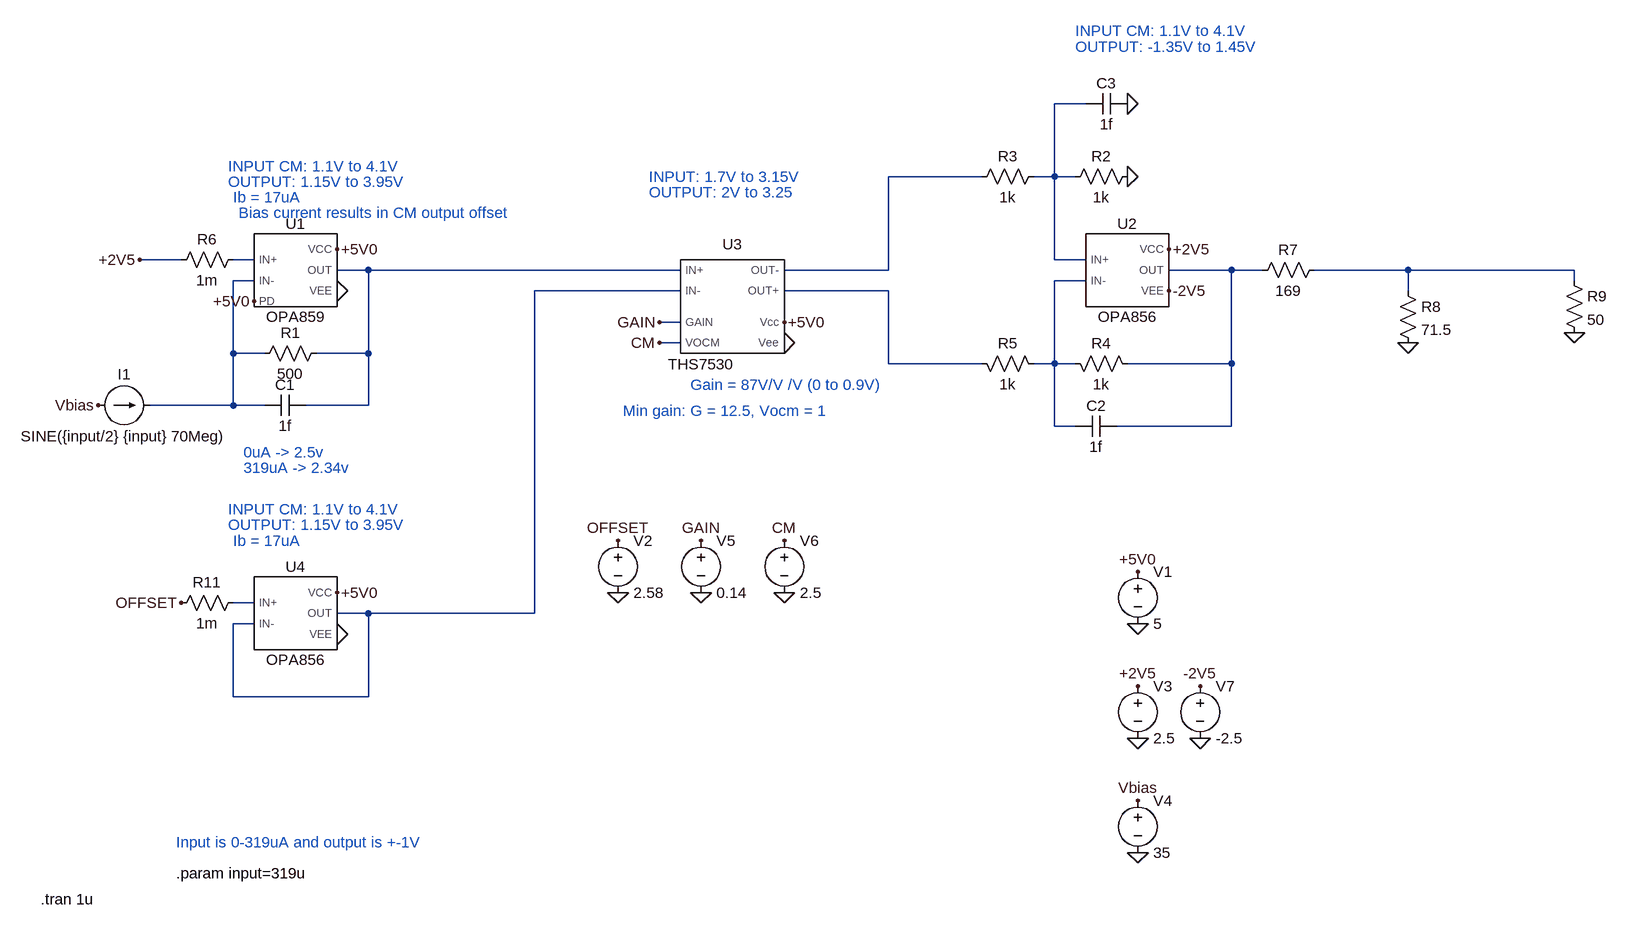
[diagram p0: schematic Ball_DC.asc]
Ball_DC.asc, the LTspice schematic file:
Version 4
SHEET 1 2072 1204
WIRE 1264 -96 1216 -96
WIRE 1104 16 960 16
WIRE 1216 16 1216 -96
WIRE 1216 16 1184 16
WIRE 1248 16 1216 16
WIRE -128 144 -192 144
WIRE -16 144 -48 144
WIRE 1216 144 1216 16
WIRE 1264 144 1216 144
WIRE 160 160 112 160
WIRE 640 160 160 160
WIRE 960 160 960 16
WIRE 960 160 800 160
WIRE 1488 160 1392 160
WIRE 1536 160 1488 160
WIRE 1760 160 1616 160
WIRE 2016 160 1760 160
WIRE -16 176 -48 176
WIRE 1264 176 1216 176
WIRE 2016 176 2016 160
WIRE 640 192 416 192
WIRE 960 192 800 192
WIRE 1760 192 1760 160
WIRE 640 240 608 240
WIRE 640 272 608 272
WIRE -48 288 -48 176
WIRE 0 288 -48 288
WIRE 160 288 160 160
WIRE 160 288 80 288
WIRE 960 304 960 192
WIRE 1104 304 960 304
WIRE 1216 304 1216 176
WIRE 1216 304 1184 304
WIRE 1248 304 1216 304
WIRE 1488 304 1488 160
WIRE 1488 304 1328 304
WIRE -48 368 -48 288
WIRE -48 368 -176 368
WIRE 0 368 -48 368
WIRE 160 368 160 288
WIRE 160 368 64 368
WIRE 1216 400 1216 304
WIRE 1248 400 1216 400
WIRE 1488 400 1488 304
WIRE 1488 400 1312 400
WIRE -16 672 -48 672
WIRE 160 688 112 688
WIRE 416 688 416 192
WIRE 416 688 160 688
WIRE -16 704 -48 704
WIRE -48 816 -48 704
WIRE 160 816 160 688
WIRE 160 816 -48 816
FLAG 1344 704 0
FLAG 1344 624 +5V0
FLAG 1344 880 0
FLAG 1344 800 +2V5
FLAG 1344 1056 0
FLAG 1344 976 Vbias
FLAG -192 144 +2V5
FLAG 112 128 +5V0
FLAG 112 192 0
FLAG -256 368 Vbias
FLAG 672 656 0
FLAG 672 576 GAIN
FLAG 800 656 0
FLAG 800 576 CM
FLAG 608 272 CM
FLAG 608 240 GAIN
FLAG 1440 880 0
FLAG 1440 800 -2V5
FLAG 1392 128 +2V5
FLAG 1392 192 -2V5
FLAG 1328 16 0
FLAG 800 240 +5V0
FLAG 800 272 0
FLAG 1328 -96 0
FLAG 1760 272 0
FLAG 2016 256 0
FLAG 112 656 +5V0
FLAG 112 720 0
FLAG 544 656 0
FLAG 544 576 OFFSET
FLAG -128 672 OFFSET
FLAG -16 208 +5V0
SYMBOL OPA856 1328 160 R0
SYMATTR InstName U2
SYMBOL THS7530 720 208 R0
SYMATTR InstName U3
SYMBOL voltage 1344 608 R0
WINDOW 123 0 0 Left 0
WINDOW 39 0 0 Left 0
SYMATTR InstName V1
SYMATTR Value 5
SYMBOL voltage 1344 784 R0
WINDOW 123 0 0 Left 0
WINDOW 39 0 0 Left 0
SYMATTR InstName V3
SYMATTR Value 2.5
SYMBOL voltage 1344 960 R0
WINDOW 123 0 0 Left 0
WINDOW 39 0 0 Left 0
SYMATTR InstName V4
SYMATTR Value 35
SYMBOL res 96 272 R90
WINDOW 0 0 56 VBottom 2
WINDOW 3 32 56 VTop 2
SYMATTR InstName R1
SYMATTR Value 500
SYMBOL cap 64 352 R90
WINDOW 0 0 32 VBottom 2
WINDOW 3 32 32 VTop 2
SYMATTR InstName C1
SYMATTR Value 1f
SYMBOL current -256 368 R270
WINDOW 0 32 40 VTop 2
WINDOW 3 -32 40 VBottom 2
WINDOW 123 0 0 Left 0
WINDOW 39 0 0 Left 0
SYMATTR InstName I1
SYMATTR Value SINE({input/2} {input} 70Meg)
SYMBOL voltage 672 560 R0
WINDOW 123 0 0 Left 0
WINDOW 39 0 0 Left 0
SYMATTR InstName V5
SYMATTR Value 0.14
SYMBOL voltage 800 560 R0
WINDOW 123 0 0 Left 0
WINDOW 39 0 0 Left 0
SYMATTR InstName V6
SYMATTR Value 2.5
SYMBOL res 1344 0 R90
WINDOW 0 0 56 VBottom 2
WINDOW 3 32 56 VTop 2
SYMATTR InstName R2
SYMATTR Value 1k
SYMBOL res 1200 0 R90
WINDOW 0 0 56 VBottom 2
WINDOW 3 32 56 VTop 2
SYMATTR InstName R3
SYMATTR Value 1k
SYMBOL voltage 1440 784 R0
WINDOW 123 0 0 Left 0
WINDOW 39 0 0 Left 0
SYMATTR InstName V7
SYMATTR Value -2.5
SYMBOL res 1344 320 M270
WINDOW 0 32 56 VTop 2
WINDOW 3 0 56 VBottom 2
SYMATTR InstName R4
SYMATTR Value 1k
SYMBOL res 1200 320 M270
WINDOW 0 32 56 VTop 2
WINDOW 3 0 56 VBottom 2
SYMATTR InstName R5
SYMATTR Value 1k
SYMBOL cap 1312 384 R90
WINDOW 0 0 32 VBottom 2
WINDOW 3 32 32 VTop 2
SYMATTR InstName C2
SYMATTR Value 1f
SYMBOL cap 1328 -112 R90
WINDOW 0 0 32 VBottom 2
WINDOW 3 32 32 VTop 2
SYMATTR InstName C3
SYMATTR Value 1f
SYMBOL res -32 128 R90
WINDOW 0 0 56 VBottom 2
WINDOW 3 32 56 VTop 2
SYMATTR InstName R6
SYMATTR Value 1m
SYMBOL res 1632 144 R90
WINDOW 0 0 56 VBottom 2
WINDOW 3 32 56 VTop 2
SYMATTR InstName R7
SYMATTR Value 169
SYMBOL res 1744 176 R0
SYMATTR InstName R8
SYMATTR Value 71.5
SYMBOL res 2000 160 R0
SYMATTR InstName R9
SYMATTR Value 50
SYMBOL res -32 656 R90
WINDOW 0 0 56 VBottom 2
WINDOW 3 32 56 VTop 2
SYMATTR InstName R11
SYMATTR Value 1m
SYMBOL OPA856 48 688 R0
SYMATTR InstName U4
SYMBOL voltage 544 560 R0
WINDOW 123 0 0 Left 0
WINDOW 39 0 0 Left 0
SYMATTR InstName V2
SYMATTR Value 2.58
SYMBOL OPA859 48 160 R0
SYMATTR InstName U1
TEXT -344 1128 Left 2 !.tran 1u
TEXT 656 336 Left 2 ;Gain = 87V/V /V (0 to 0.9V)
TEXT -56 0 Left 2 ;INPUT CM: 1.1V to 4.1V
TEXT -56 24 Left 2 ;OUTPUT: 1.15V to 3.95V
TEXT 592 16 Left 2 ;INPUT: 1.7V to 3.15V
TEXT 592 40 Left 2 ;OUTPUT: 2V to 3.25
TEXT 1248 -208 Left 2 ;INPUT CM: 1.1V to 4.1V
TEXT 1248 -184 Left 2 ;OUTPUT: -1.35V to 1.45V
TEXT -136 1040 Left 2 ;Input is 0-319uA and output is +-1V
TEXT -32 440 Left 2 ;0uA -> 2.5v
TEXT -32 464 Left 2 ;319uA -> 2.34v
TEXT 552 376 Left 2 ;Min gain: G = 12.5, Vocm = 1
TEXT -48 48 Left 2 ;Ib = 17uA
TEXT -136 1088 Left 2 !.param input=319u
TEXT -40 72 Left 2 ;Bias current results in CM output offset
TEXT -56 528 Left 2 ;INPUT CM: 1.1V to 4.1V
TEXT -56 552 Left 2 ;OUTPUT: 1.15V to 3.95V
TEXT -48 576 Left 2 ;Ib = 17uA

The netlist it stands for:
* Ball_DC.asc
XU2 N001 N008 +2V5 -2V5 N005 OPA856  ; pins IN+ IN- VCC VEE OUT
XU3 N004 N009 +5V0 0 N002 N010 CM GAIN THS7530  ; pins IN+ IN- Vcc Vee OUT- OUT+ VOCM GAIN
V1 +5V0 0 5
V3 +2V5 0 2.5
V4 Vbias 0 35
R1 N004 N007 500
C1 N004 N007 1f
I1 Vbias N007 SINE({input/2} {input} 70Meg)
V5 GAIN 0 0.14
V6 CM 0 2.5
R2 0 N001 1k
R3 N001 N002 1k
V7 -2V5 0 -2.5
R4 N005 N008 1k
R5 N008 N010 1k
C2 N005 N008 1f
C3 0 N001 1f
R6 N003 +2V5 1m
R7 N006 N005 169
R8 N006 0 71.5
R9 N006 0 50
R11 N011 OFFSET 1m
XU4 N011 N009 +5V0 0 N009 OPA856  ; pins IN+ IN- VCC VEE OUT
V2 OFFSET 0 2.58
XU1 N003 N007 +5V0 0 N004 +5V0 OPA859  ; pins IN+ IN- VCC VEE OUT PD
.tran 1u
* Gain = 87V/V /V (0 to 0.9V)
* INPUT CM: 1.1V to 4.1V
* OUTPUT: 1.15V to 3.95V
* INPUT: 1.7V to 3.15V
* OUTPUT: 2V to 3.25
* INPUT CM: 1.1V to 4.1V
* OUTPUT: -1.35V to 1.45V
* Input is 0-319uA and output is +-1V
* 0uA -> 2.5v
* 319uA -> 2.34v
* Min gain: G = 12.5, Vocm = 1
* Ib = 17uA
.param input=319u
* Bias current results in CM output offset
* INPUT CM: 1.1V to 4.1V
* OUTPUT: 1.15V to 3.95V
* Ib = 17uA
.lib C:\Users\kheyer\OpticallyIsolatedProbe\Simulations\Balls\opa856_a.lib
.lib C:\Users\kheyer\OpticallyIsolatedProbe\Simulations\Balls\THS7530.LIB
.lib C:\Users\kheyer\OpticallyIsolatedProbe\Simulations\Balls\OPA859.lib
.backanno
.end